# EAGLE design SPSU (EAGLE 9.6.2)
PCB_VERSION: V3.0; SCHEMATIC_VERSION: V3.0

## Sheet 1 of 6: IO-Extender
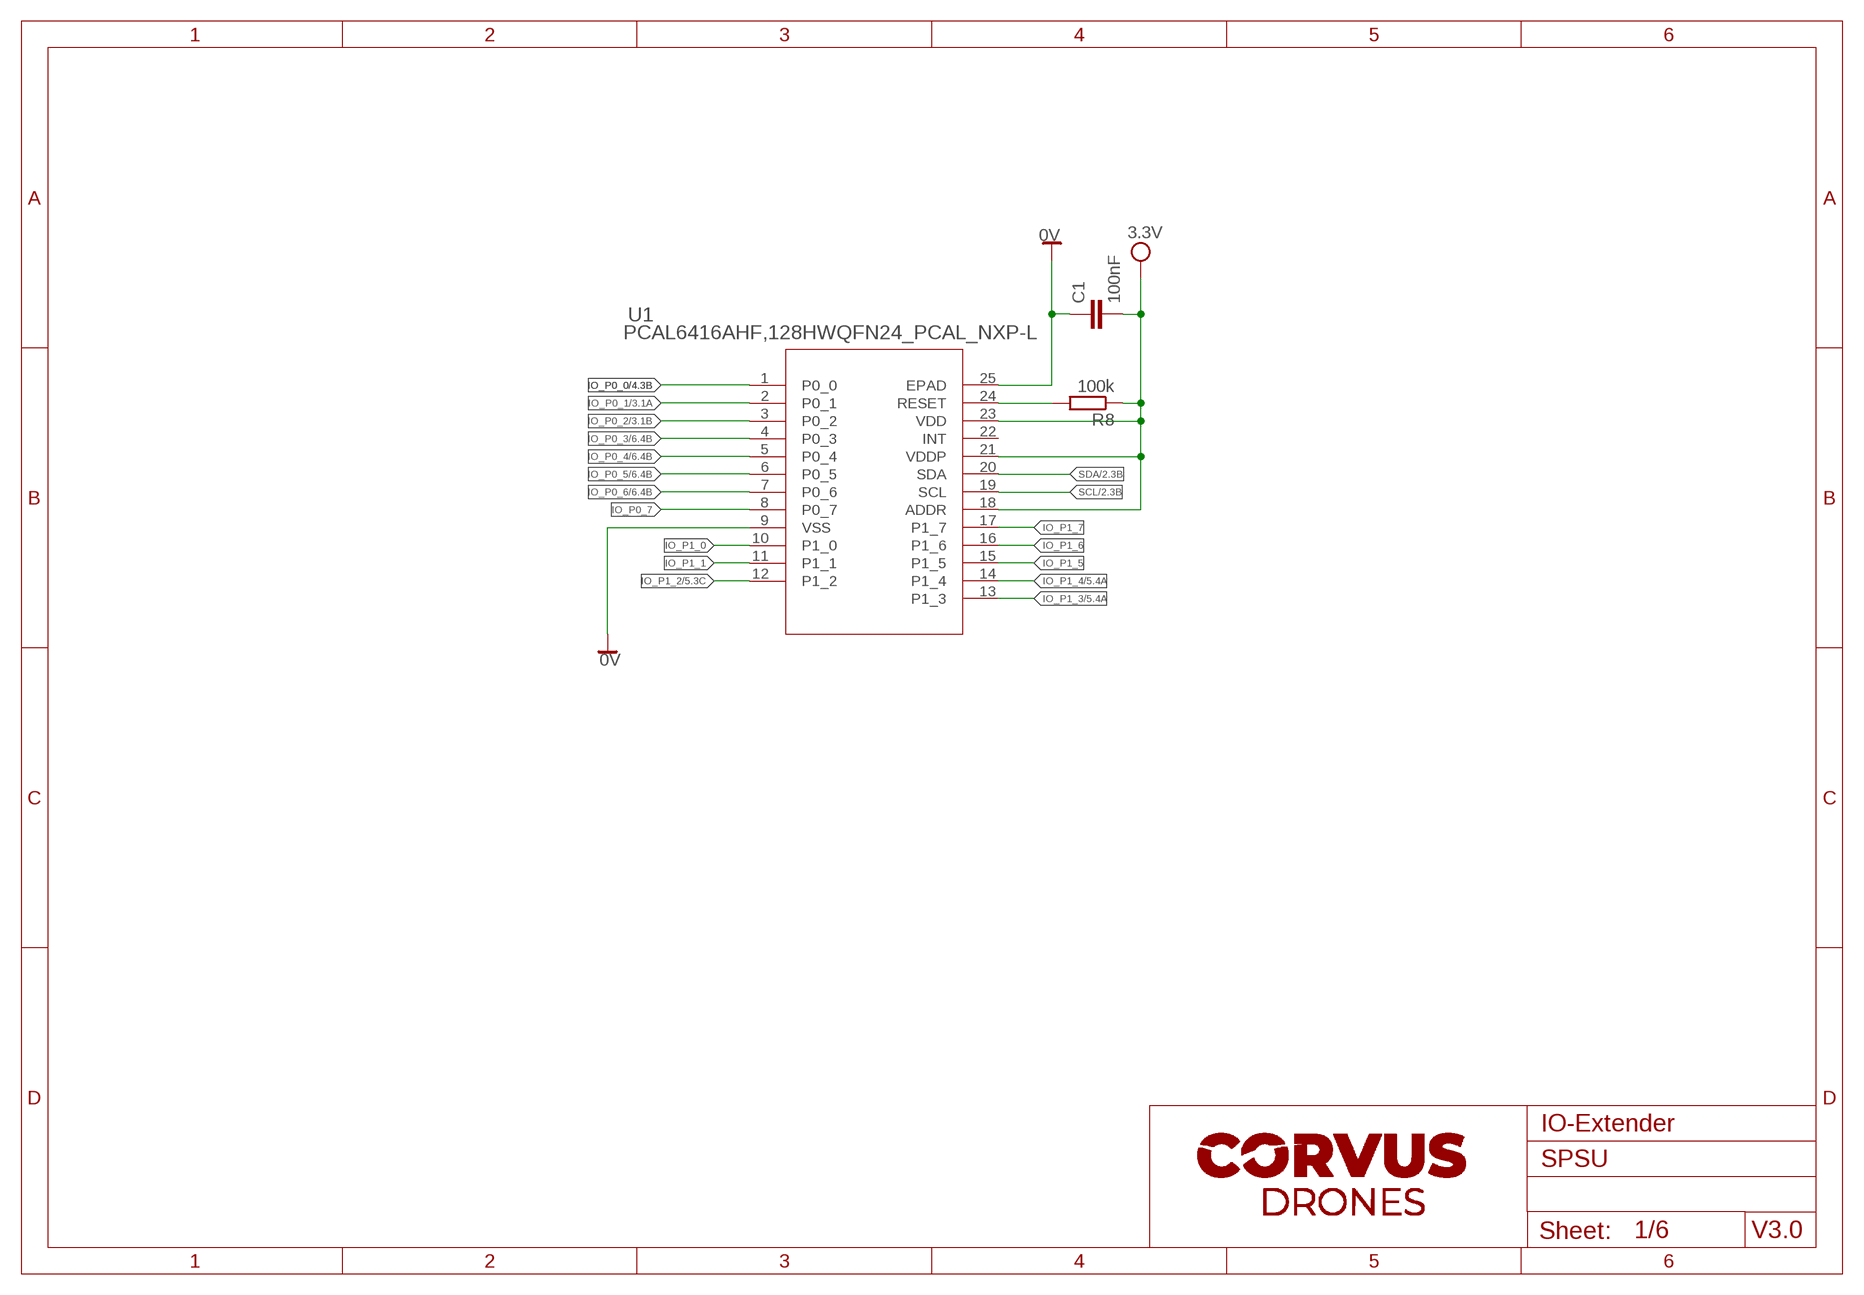
[diagram p0: schematic, sheet 1]

### Parts
C1  100nF  C_0603_100N  [C0603]
R8  100k  R_0603_100K  [R0603]
U1  PCAL6416AHF,128HWQFN24_PCAL_NXP-L  [HWQFN24_PCAL_NXP-L]

### Nets
0V: C1.1 U1.9(VSS) U1.25(EPAD) ; also sheet 2,3,4,5,6
IO_P0_0: U1.1(P0_0) ; also sheet 4
IO_P0_1: U1.2(P0_1) ; also sheet 3
IO_P0_2: U1.3(P0_2) ; also sheet 3
IO_P0_3: U1.4(P0_3) ; also sheet 6
IO_P0_4: U1.5(P0_4) ; also sheet 6
IO_P0_5: U1.6(P0_5) ; also sheet 6
IO_P0_6: U1.7(P0_6) ; also sheet 6
IO_P0_7: U1.8(P0_7)
IO_P1_0: U1.10(P1_0)
IO_P1_1: U1.11(P1_1)
IO_P1_2: U1.12(P1_2) ; also sheet 5
IO_P1_3: U1.13(P1_3) ; also sheet 5
IO_P1_4: U1.14(P1_4) ; also sheet 5
IO_P1_5: U1.15(P1_5)
IO_P1_6: U1.16(P1_6)
IO_P1_7: U1.17(P1_7)
N$7: R8.2 U1.24(RESET)
SCL: U1.19(SCL) ; also sheet 2,4
SDA: U1.20(SDA) ; also sheet 2,4
VDD: C1.2 R8.1 U1.18(ADDR) U1.21(VDDP) U1.23(VDD) ; supply symbol labelled 3.3V ; also sheet 2
Unconnected: U1.22(INT)

## Sheet 2 of 6: Connection Powermodule
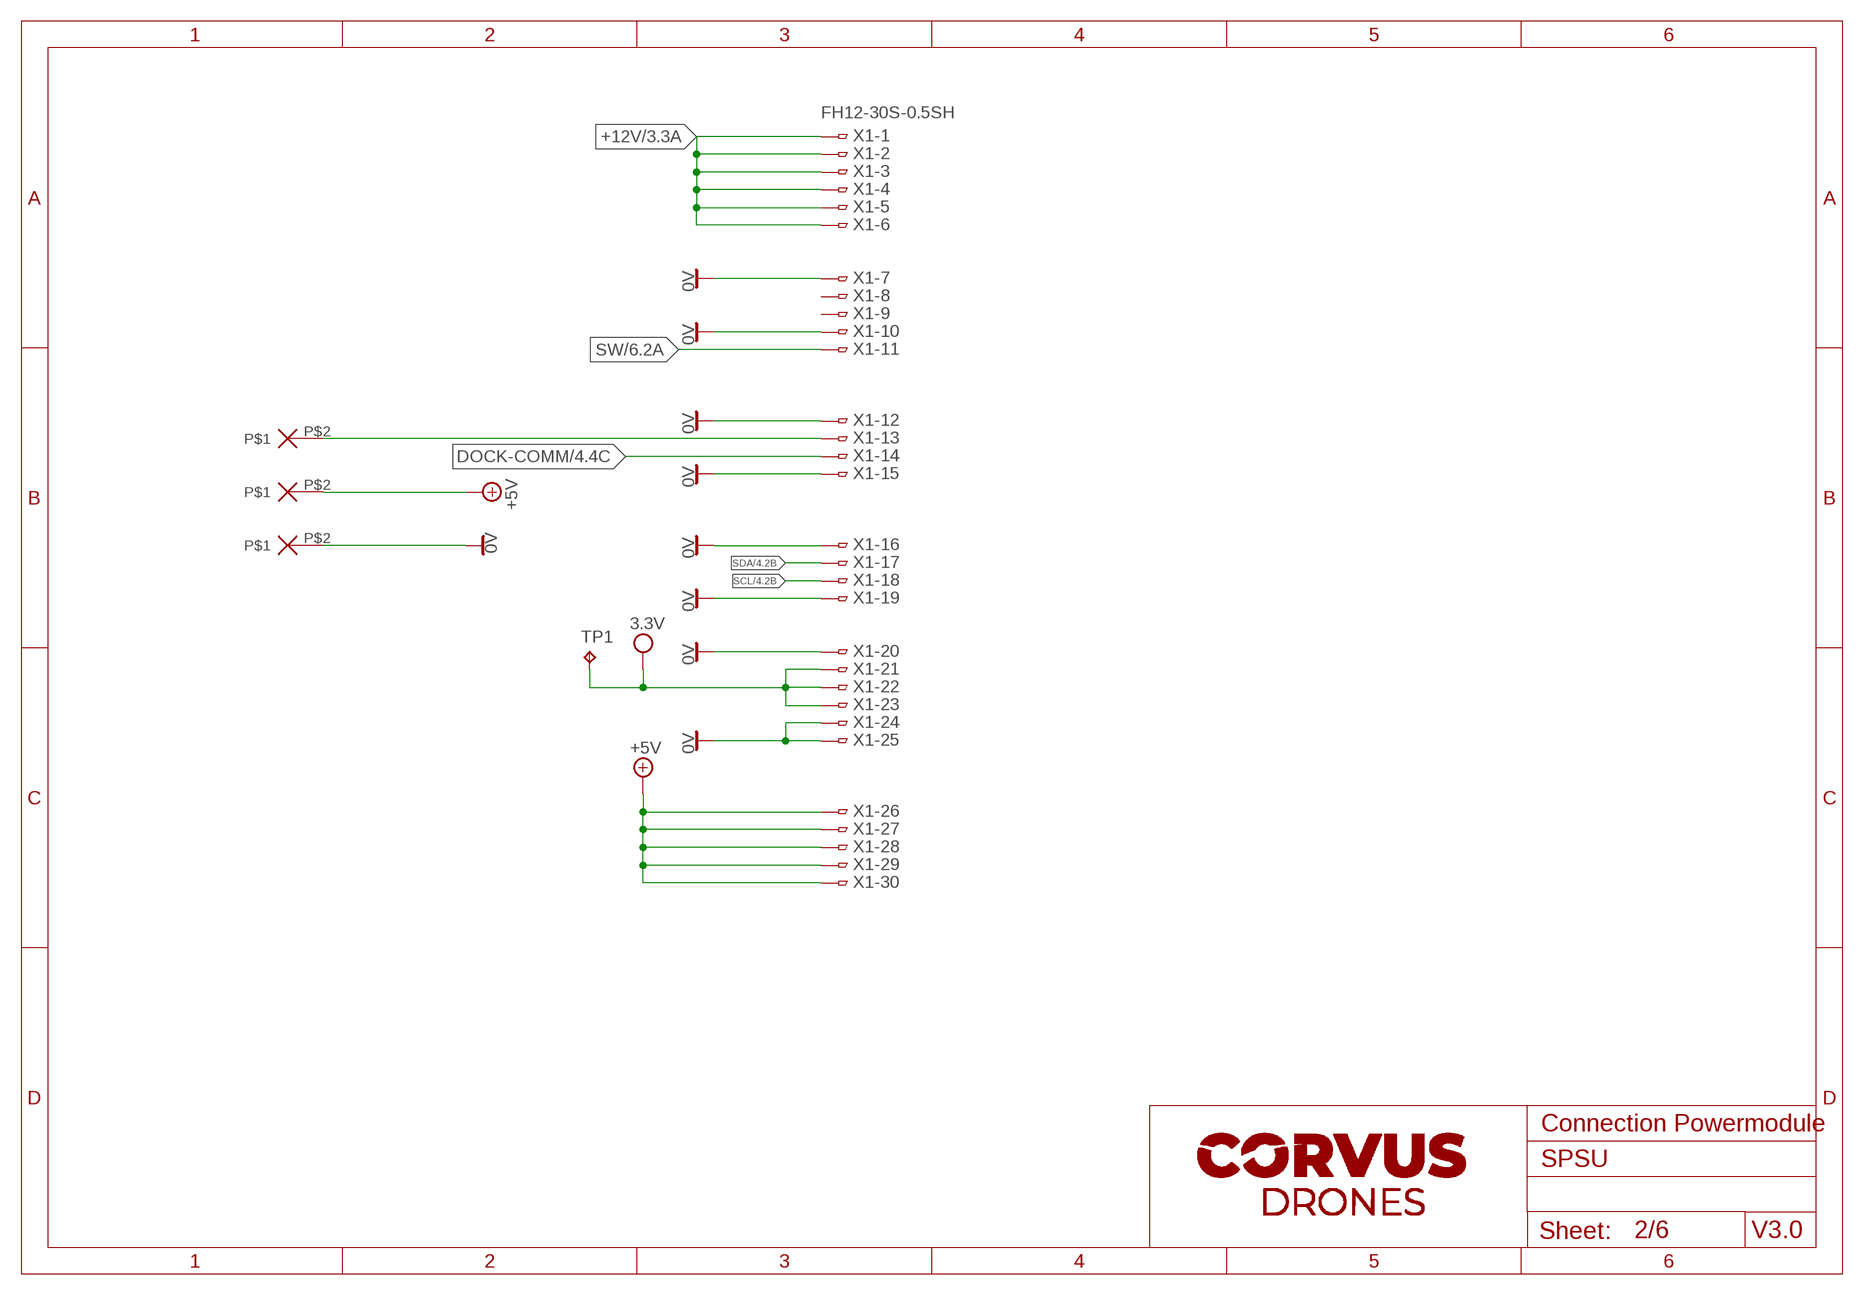
[diagram p1: schematic, sheet 2]

### Parts
+  TH-0.75/0.6  [TH-0.75/0.6]
-  TH-0.75/0.6  [TH-0.75/0.6]
D  TH-0.75/0.6  [TH-0.75/0.6]
TP1  TPTP11R  [TP11R]
X1  FH12-30S-0.5SH  [FH12-30S-0.5SH]

### Nets
0V: -.P$2 X1.7 X1.10 X1.12 X1.15 X1.16 X1.19 X1.20 X1.24 X1.25 ; also sheet 1,3,4,5,6
+5V: +.P$2 X1.26 X1.27 X1.28 X1.29 X1.30 ; also sheet 3,5
+12V: X1.1 X1.2 X1.3 X1.4 X1.5 X1.6 ; also sheet 3,4
DOCK-COMM: X1.14 ; also sheet 4
N$13: D.P$2 X1.13
SCL: X1.18 ; also sheet 1,4
SDA: X1.17 ; also sheet 1,4
SW: X1.11 ; also sheet 6
VDD: TP1.TP X1.21 X1.22 X1.23 ; supply symbol labelled 3.3V ; also sheet 1
Unconnected: X1.8 X1.9

## Sheet 3 of 6: Mosfet driving
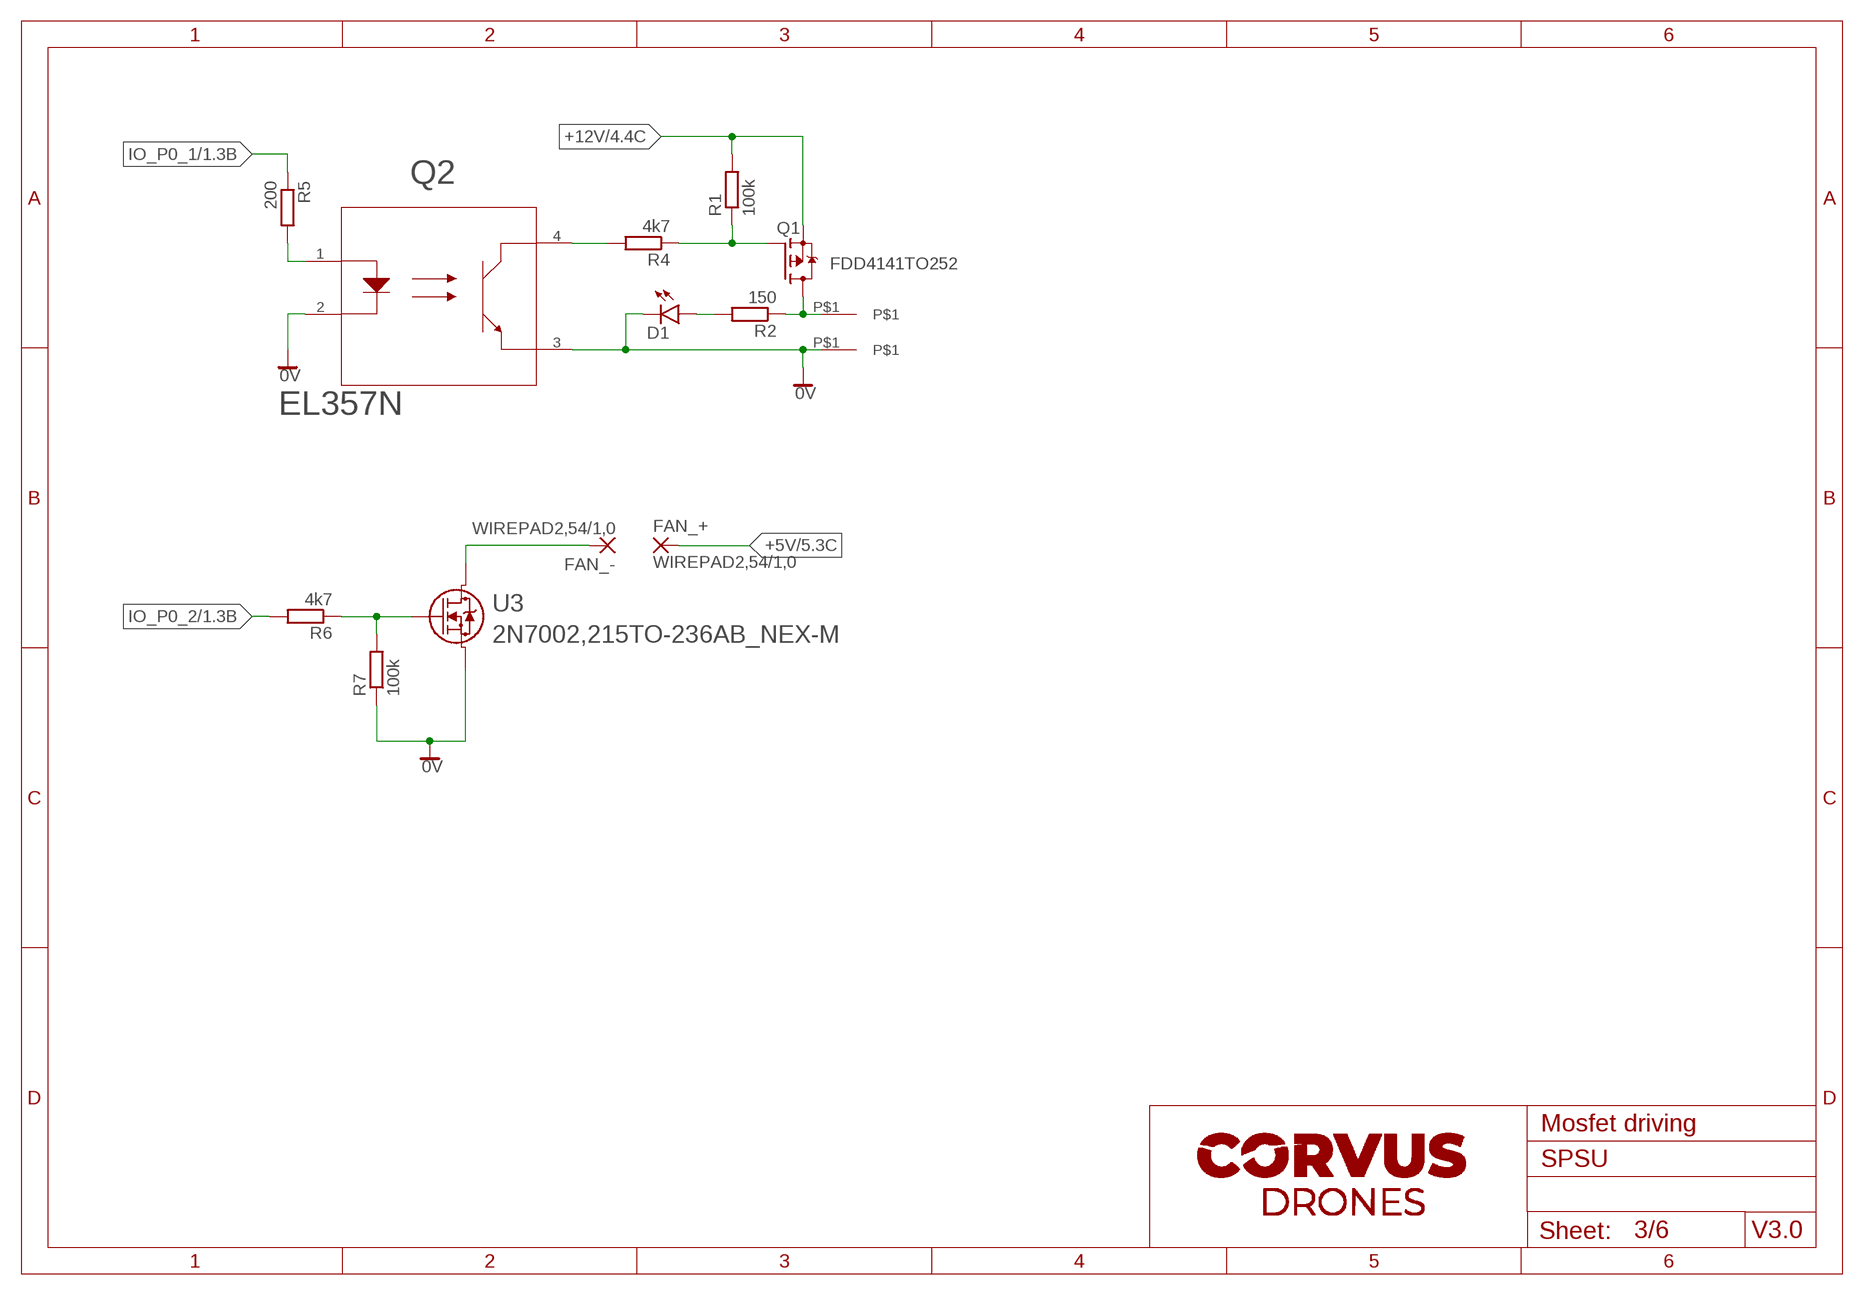
[diagram p2: schematic, sheet 3]

### Parts
D1  LEDCHIPLED_0805  [CHIPLED_0805]
ESC+  ESC  [ESC]
ESC-  ESC  [ESC]
FAN_+  WIREPAD2,54/1,0  [2,54/1,0]
FAN_-  WIREPAD2,54/1,0  [2,54/1,0]
Q1  FDD4141TO252  [TO252]
Q2  EL357N  EL357N(C)(TA)-VGEL357N(C)(TA)-VG_EVE-L  [EL357N(C)(TA)-VG_EVE-L]
R1  100k  R_0603_100K  [R0603]
R2  150  R-EU_R0603  [R0603]
R4  4k7  R_0603_4K7  [R0603]
R5  200  R-EU_R0603  [R0603]
R6  4k7  R_0603_4K7  [R0603]
R7  100k  R_0603_100K  [R0603]
U3  2N7002,215TO-236AB_NEX-M  [TO-236AB_NEX-M]

### Nets
0V: D1.C ESC-.P$1 Q2.2 Q2.3 R7.1 U3.2 ; also sheet 1,2,4,5,6
+5V: FAN_+.1(P) ; also sheet 2,5
+12V: Q1.2(S) R1.2 ; also sheet 2,4
ESC_+: ESC+.P$1 Q1.3(D) R2.1
IO_P0_1: R5.1 ; also sheet 1
IO_P0_2: R6.2 ; also sheet 1
N$1: Q1.1(G) R1.1 R4.1
N$2: D1.A R2.2
N$3: Q2.4 R4.2
N$4: Q2.1 R5.2
N$5: R6.1 R7.2 U3.1
N$6: FAN_-.1(P) U3.3

## Sheet 4 of 6: Pad connections
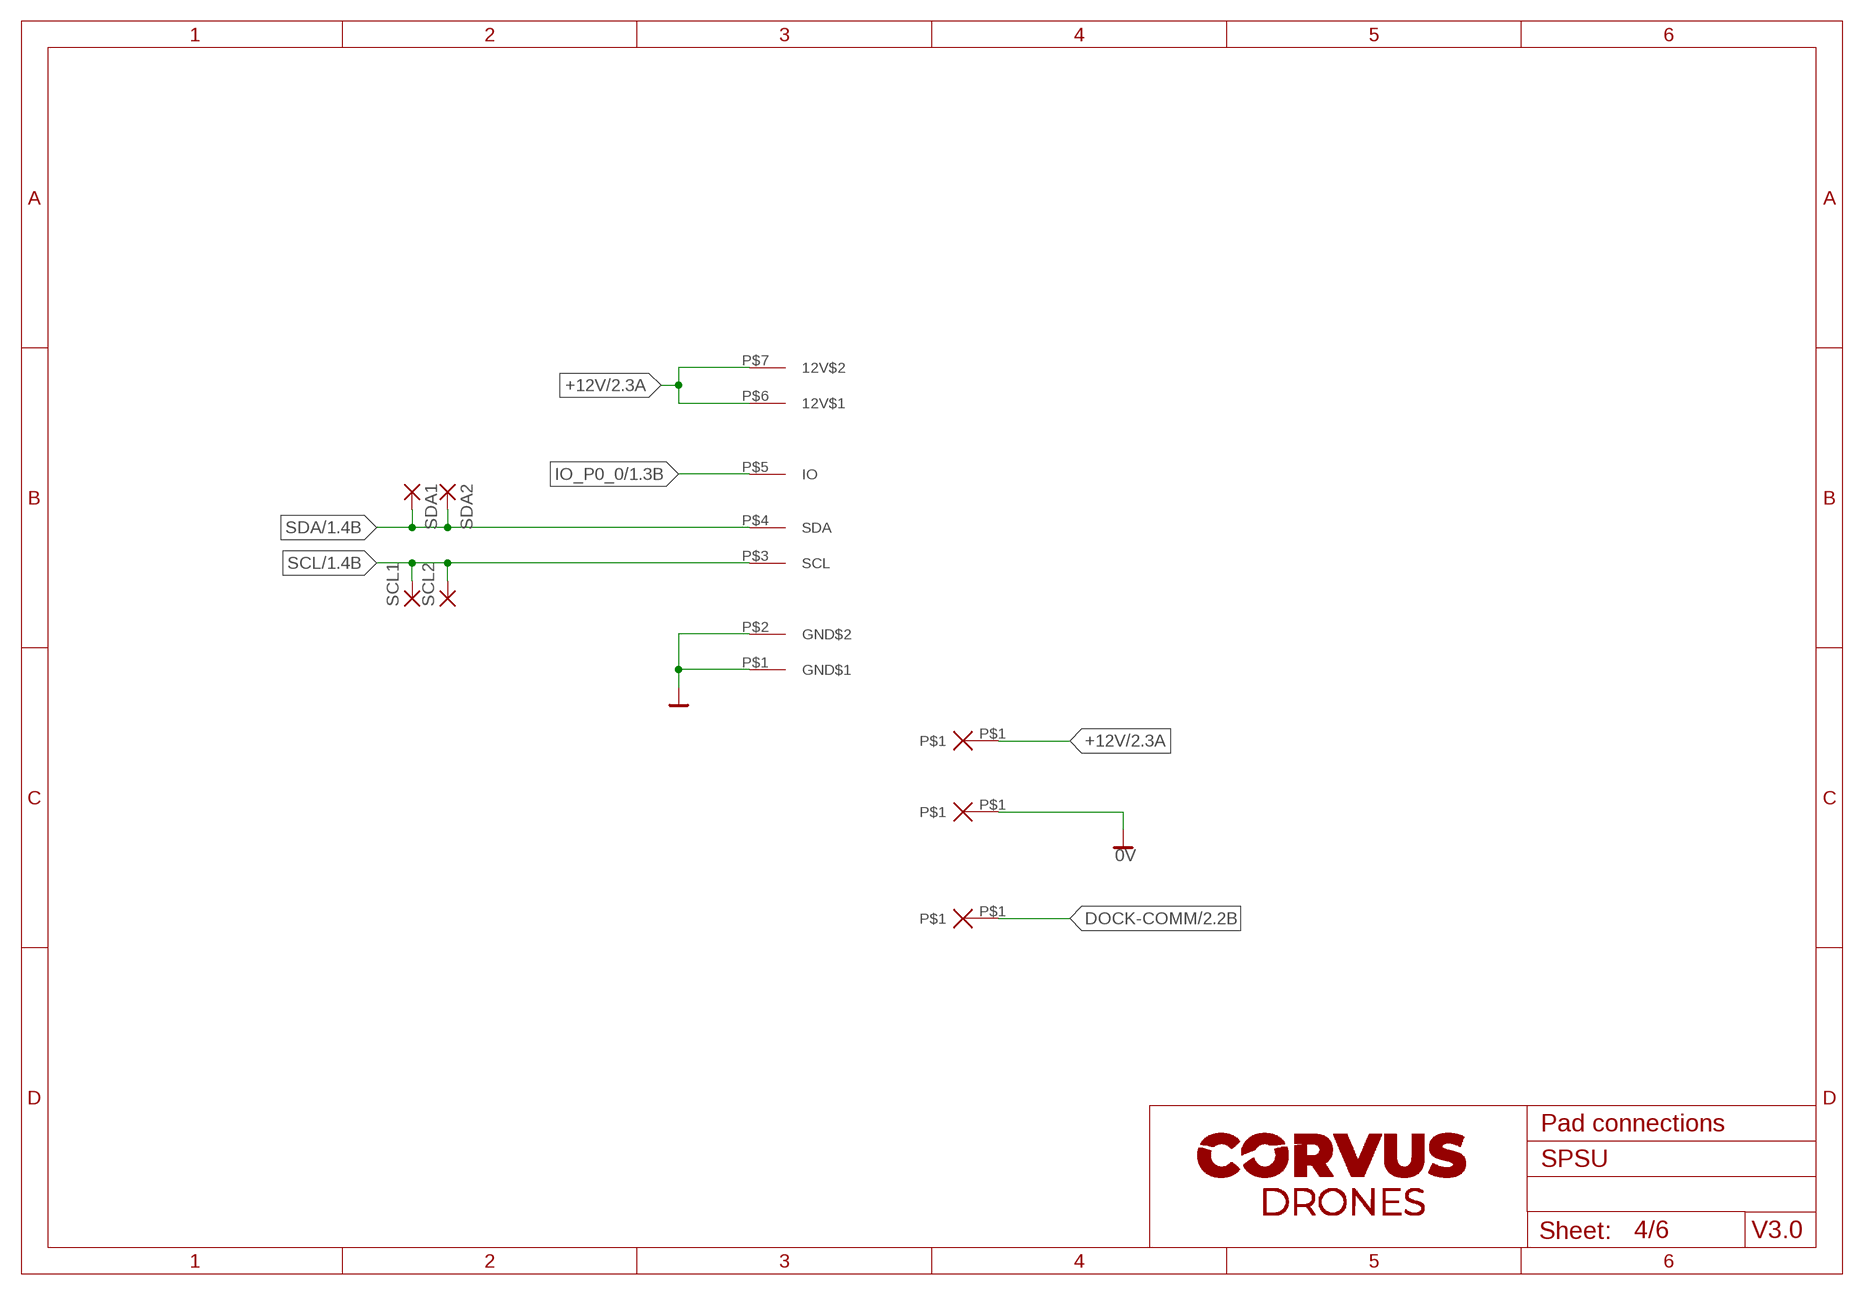
[diagram p3: schematic, sheet 4]

### Parts
CHG+  SMT-PAD_SQ6MM  [SMT-PAD_SQ6MM]
CHG-  SMT-PAD_SQ6MM  [SMT-PAD_SQ6MM]
SCL1  1,6/0,8  [1,6/0,8]
SCL2  1,6/0,8  [1,6/0,8]
SDA1  1,6/0,8  [1,6/0,8]
SDA2  1,6/0,8  [1,6/0,8]
U$1  BATT_CON_THT  [BATT_CON_THT]
U$2  SMT-PAD_R3MM  [SMT-PAD_R3MM]

### Nets
0V: CHG-.P$1 U$1.P$1(GND$1) U$1.P$2(GND$2) ; also sheet 1,2,3,5,6
+12V: CHG+.P$1 U$1.P$6(12V$1) U$1.P$7(12V$2) ; also sheet 2,3
DOCK-COMM: U$2.P$1 ; also sheet 2
IO_P0_0: U$1.P$5(IO) ; also sheet 1
SCL: SCL1.1(P) SCL2.1(P) U$1.P$3(SCL) ; also sheet 1,2
SDA: SDA1.1(P) SDA2.1(P) U$1.P$4(SDA) ; also sheet 1,2

## Sheet 5 of 6: ADB detection
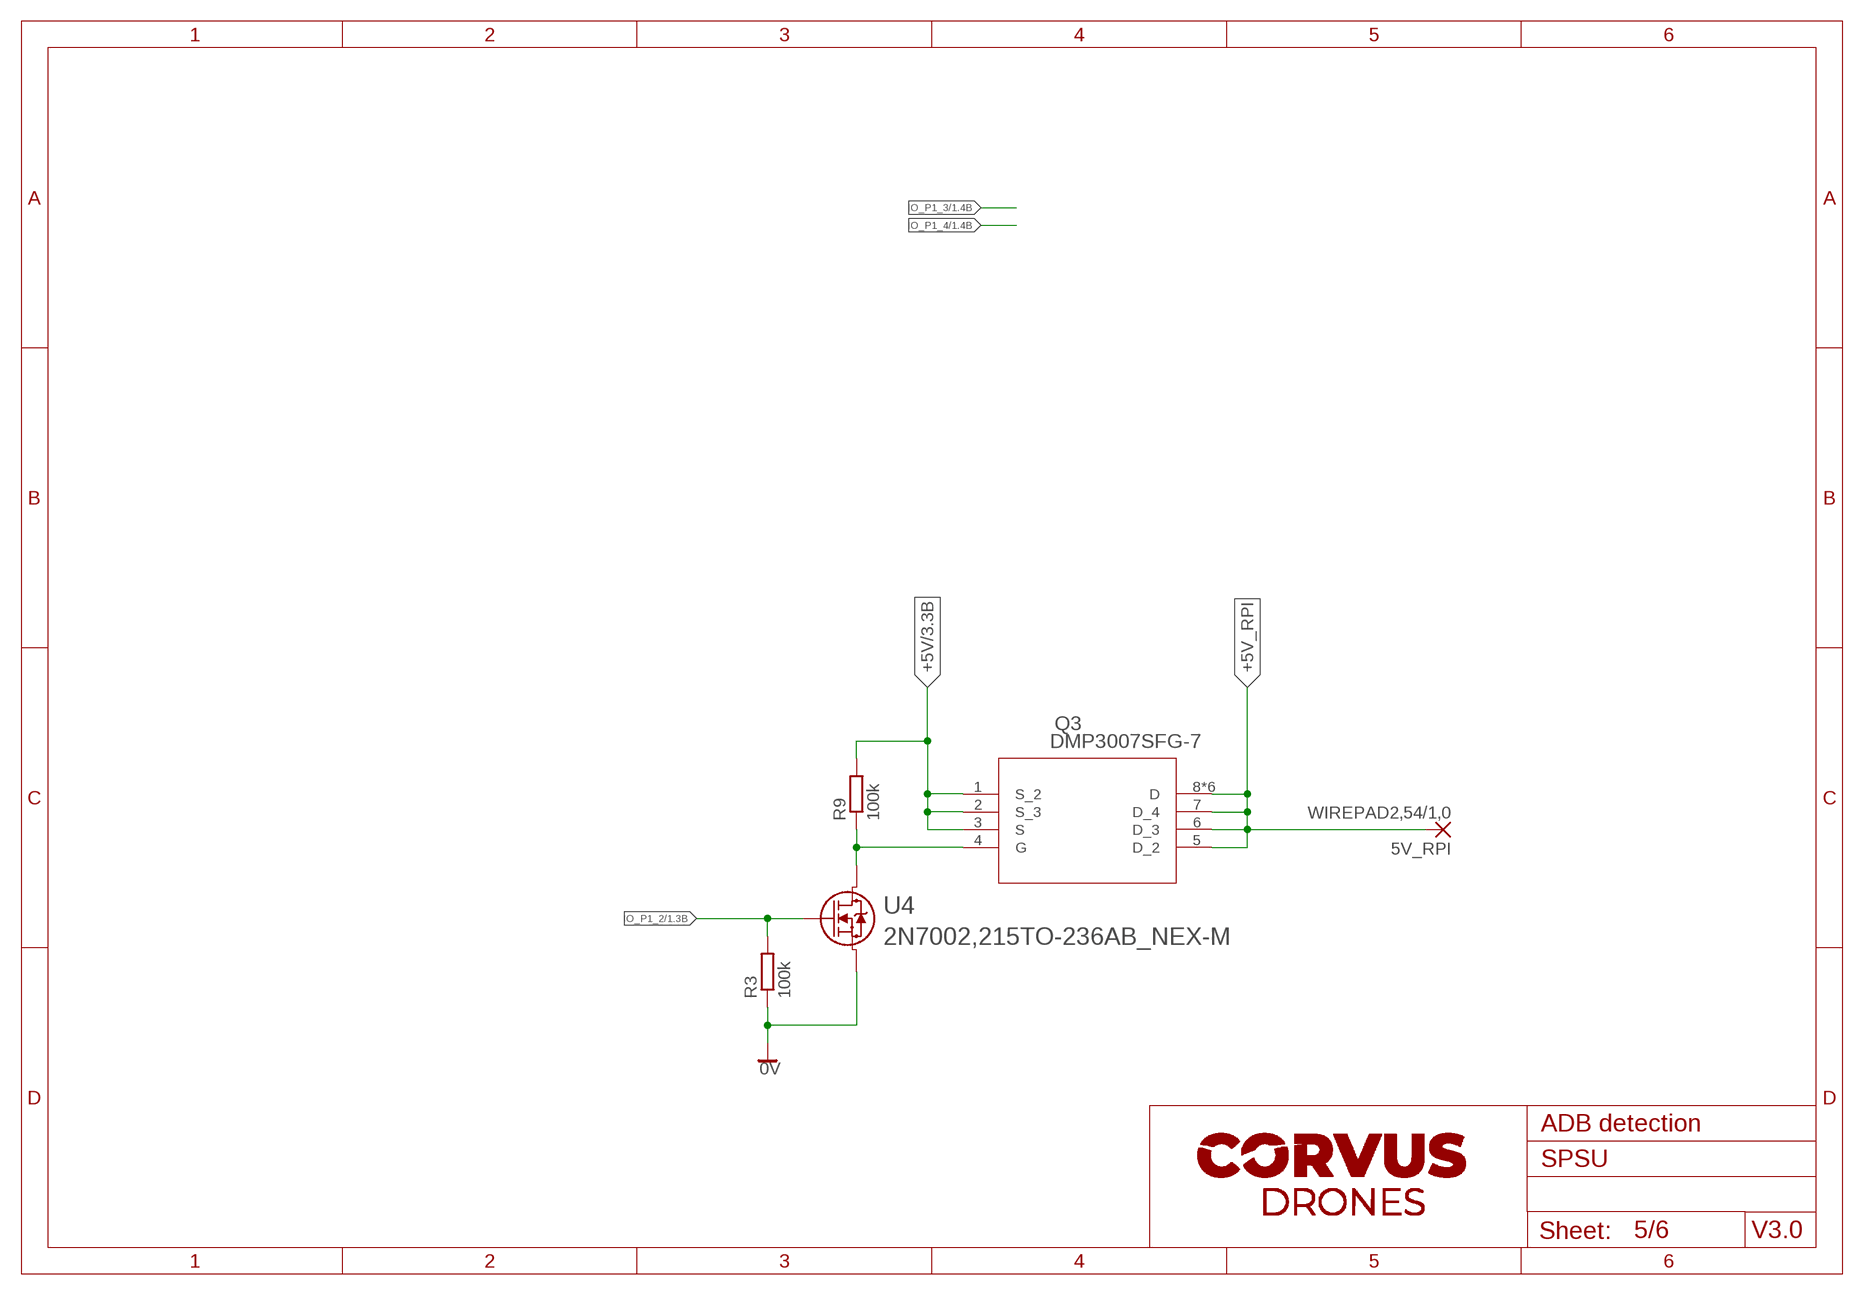
[diagram p4: schematic, sheet 5]

### Parts
5V_RPI  WIREPAD2,54/1,0  [2,54/1,0]
Q3  DMP3007SFG-7  [POWERDI3333-8_3P3X3P3_DIO]
R3  100k  R_0603_100K  [R0603]
R9  100k  R_0603_100K  [R0603]
U4  2N7002,215TO-236AB_NEX-M  [TO-236AB_NEX-M]

### Nets
0V: R3.1 U4.2 ; also sheet 1,2,3,4,6
+5V: Q3.1(S_2) Q3.2(S_3) Q3.3(S) R9.2 ; also sheet 2,3
+5V_RPI: 5V_RPI.1(P) Q3.5(D_2) Q3.6(D_3) Q3.7(D_4) Q3.8(D) Q3.9(D) Q3.10(D) Q3.11(D) Q3.12(D) Q3.13(D)
IO_P1_2: R3.2 U4.1 ; also sheet 1
N$8: Q3.4(G) R9.1 U4.3

## Sheet 6 of 6: HMI Part
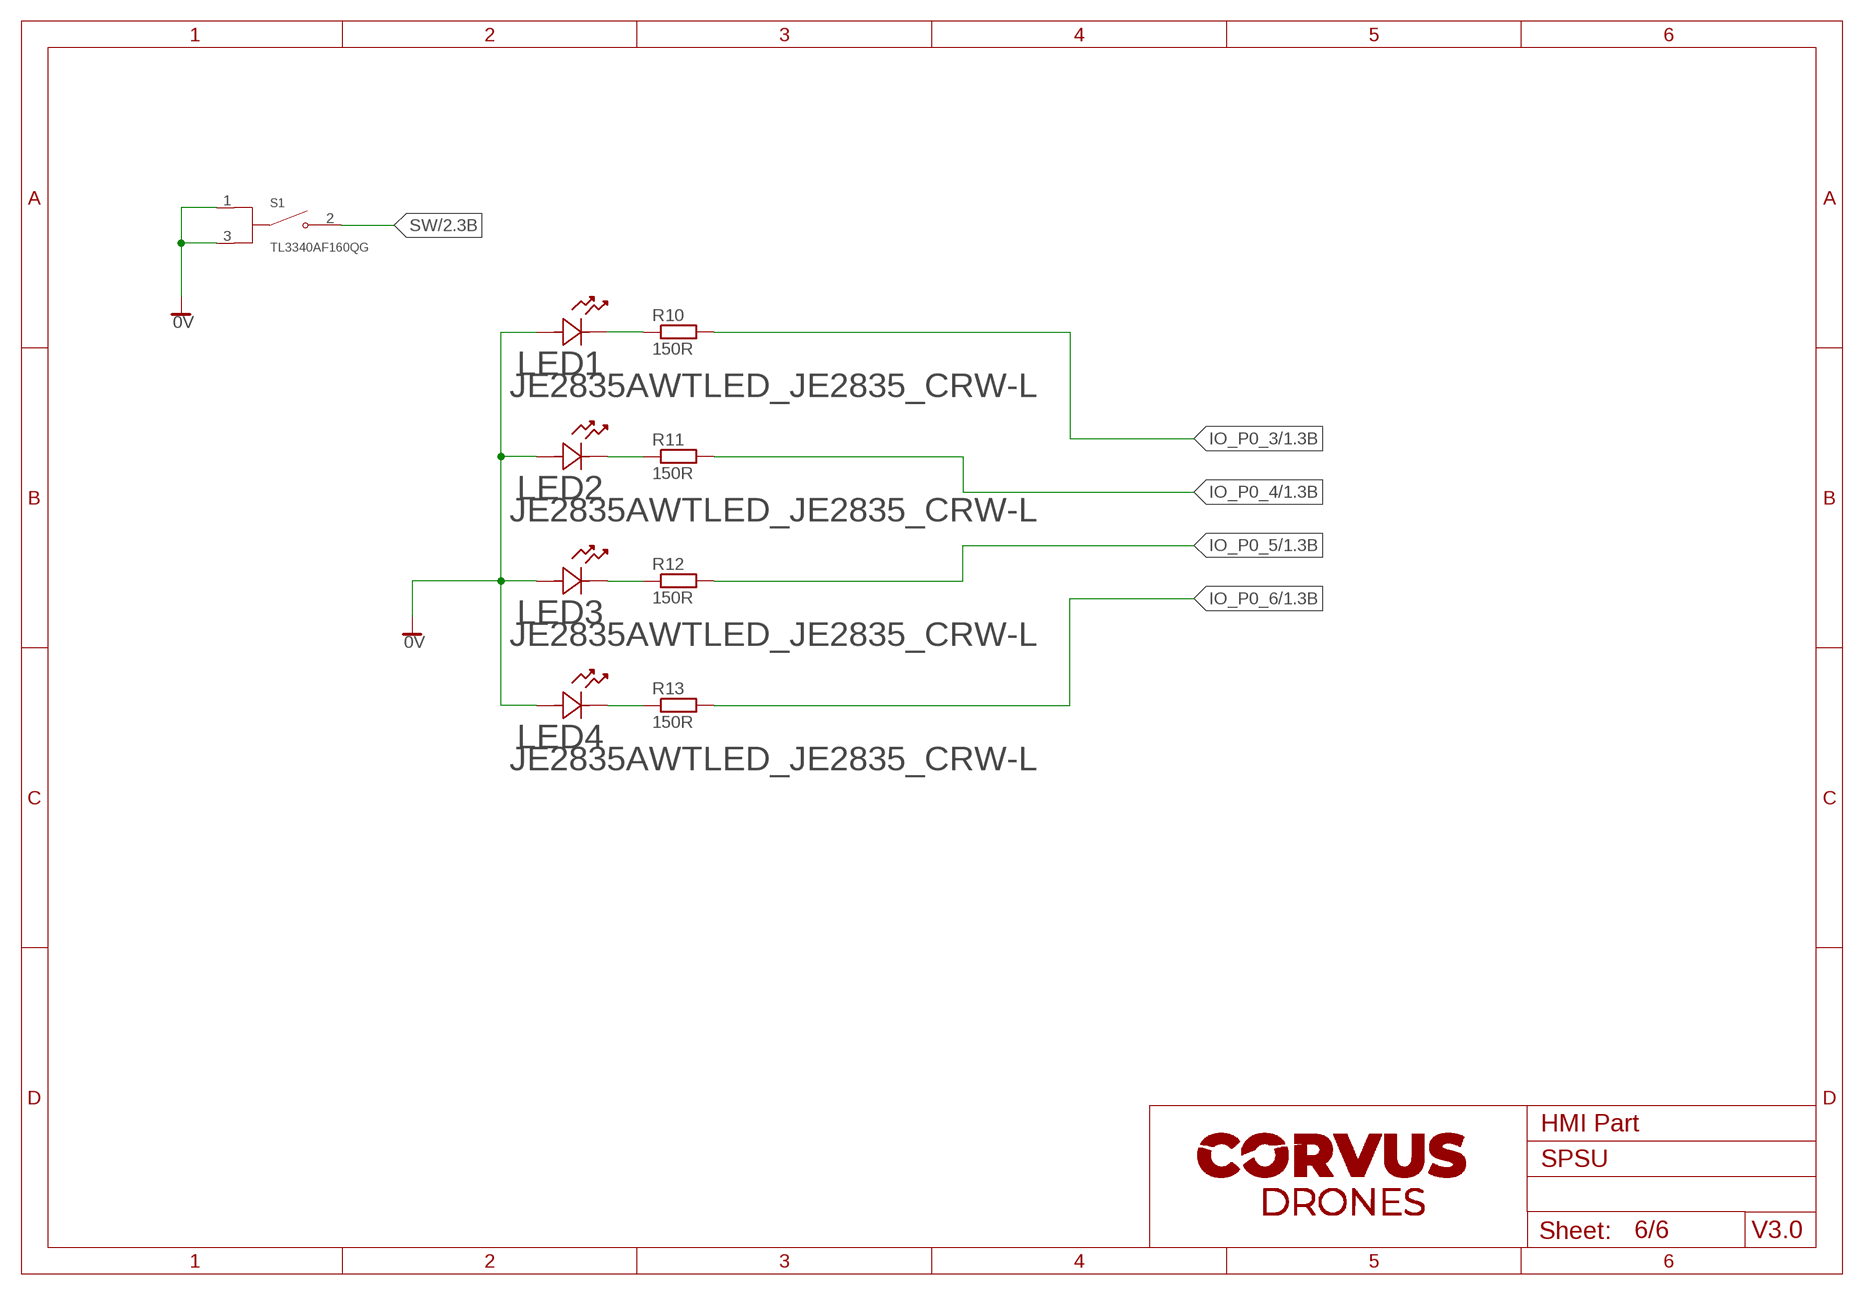
[diagram p5: schematic, sheet 6]

### Parts
LED1  JE2835AWTLED_JE2835_CRW-L  [LED_JE2835_CRW-L]
LED2  JE2835AWTLED_JE2835_CRW-L  [LED_JE2835_CRW-L]
LED3  JE2835AWTLED_JE2835_CRW-L  [LED_JE2835_CRW-L]
LED4  JE2835AWTLED_JE2835_CRW-L  [LED_JE2835_CRW-L]
R10  150R  R_0603_150R  [R0603]
R11  150R  R_0603_150R  [R0603]
R12  150R  R_0603_150R  [R0603]
R13  150R  R_0603_150R  [R0603]
S1  TL3340AF160QG  [SW_TL3340AF160QG]

### Nets
0V: LED1.1 LED2.1 LED3.1 LED4.1 S1.1(COM_1) S1.3(COM_2) ; also sheet 1,2,3,4,5
IO_P0_3: R10.2 ; also sheet 1
IO_P0_4: R11.2 ; also sheet 1
IO_P0_5: R12.2 ; also sheet 1
IO_P0_6: R13.2 ; also sheet 1
N$9: LED1.2 R10.1
N$10: LED2.2 R11.1
N$11: LED3.2 R12.1
N$12: LED4.2 R13.1
SW: S1.2(NO) ; also sheet 2

## Library data of the parts
5V_RPI FAN_+ FAN_- = wirepad:WIREPAD: Wire PAD connect wire on PCB
+ - D = corvus_holes:TH-0.75/0.6
C1 = corvus_RC:C_0603; FARNELL: 2320813
CHG+ CHG- = corvus_holes:SMT-PAD_SQ6MM
D1 = led_CUSTOM:LED: LED OSRAM: - CHIPLED LG R971, LG N971, LY N971, LG Q971, LY Q971, LO R971, LY R971 LH N974, LH R974 LS Q976, LO Q976, LY Q976 LO Q996 - Hyper CHIPLED LW Q18S LB Q993, LB Q99A, LB R99A - SideLED LS A670, LO A670, LY A670, LG A670, LP A670 LB A673, LV A673, LT A673, LW A673 LH A674 LY A675 LS A676, LA A676, LO A676, LY A676, LW A676 LS A679, LY A679, LG A679 - Hyper Micro SIDELED® LS Y876, LA Y876, LO Y876, LY Y876 LT Y87S - SmartLED LW L88C, LW L88S LB L89C, LB L89S, LG L890 LS L89K, LO L89K, LY L89K LS L896, LA L896, LO L896, LY L896 - TOPLED LS T670, LO T670, LY T670, LG T670, LP T670 LSG T670, LSP T670, LSY T670, LOP T670, LYG T670 LG T671, LOG T671, LSG T671 LB T673, LV T673, LT T673, LW T673 LH T674 LS T676, LA T676, LO T676, LY T676, LB T676, LH T676, LSB T676, LW T676 LB T67C, LV T67C, LT T67C, LS T67K, LO T67K, LY T67K, LW E67C LS E67B, LA E67B, LO E67B, LY E67B, LB E67C, LV E67C, LT E67C LW T67C LS T679, LY T679, LG T679 LS T770, LO T770, LY T770, LG T770, LP T770 LB T773, LV T773, LT T773, LW T773 LH T774 LS E675, LA E675, LY E675, LS T675 LS T776, LA T776, LO T776, LY T776, LB T776 LHGB T686 LT T68C, LB T68C - Hyper Mini TOPLED® LB M676 - Mini TOPLED Santana® LG M470 LS M47K, LO M47K, LY M47K Source: http://www.osram.convergy.de LUXEON: - LUMILED® LXK2-PW12-R00, LXK2-PW12-S00, LXK2-PW14-U00, LXK2-PW14-V00 LXK2-PM12-R00, LXK2-PM12-S00, LXK2-PM14-U00 LXK2-PE12-Q00, LXK2-PE12-R00, LXK2-PE12-S00, LXK2-PE14-T00, LXK2-PE14-U00 LXK2-PB12-K00, LXK2-PB12-L00, LXK2-PB12-M00, LXK2-PB14-N00, LXK2-PB14-P00, LXK2-PB14-Q00 LXK2-PR12-L00, LXK2-PR12-M00, LXK2-PR14-Q00, LXK2-PR14-R00 LXK2-PD12-Q00, LXK2-PD12-R00, LXK2-PD12-S00 LXK2-PH12-R00, LXK2-PH12-S00 LXK2-PL12-P00, LXK2-PL12-Q00, LXK2-PL12-R00 Source: www.luxeon.com KINGBRIGHT: KA-3528ASYC Source: www.kingbright.com
ESC+ ESC- = corvus:ESC
LED1-LED4 = HBLED:JE2835AWT; COPYRIGHT: Copyright (C) 2022 Ultra Librarian. All rights reserved.; MANUFACTURER_PART_NUMBER: JE2835AWT-00-0000-000A0UF830E; MFR_NAME: Wolfspeed
Q1 = transistor-fet:FDD4141: P-Channel PowerTrench® MOSFET Source: FDD4141.pdf
Q2 = EL357N:EL357N(C)(TA)-VG; COPYRIGHT: Copyright (C) 2022 Ultra Librarian. All rights reserved.; DIGI-KEY_PART_NUMBER_1: 1080-1601-2-ND; DIGI-KEY_PART_NUMBER_2: 1080-1601-1-ND; DIGI-KEY_PART_NUMBER_3: 1080-1601-6-ND; MANUFACTURER_PART_NUMBER: EL357N(C)(TA)-VG; MFR_NAME: Everlight
Q3 = Mosfets:DMP3007SFG-7; COPYRIGHT: Copyright (C) 2022 Ultra Librarian. All rights reserved.; MANUFACTURER_PART_NUMBER: DMP3007SFG-7; MFR_NAME: Diodes Inc
R1 R3 R7-R9 = corvus_RC:R_0603; FARNELL: 2447226
R2 R5 = rcl_CUSTOM:R-EU_: RESISTOR, European symbol; SPICEPREFIX: R
R4 R6 = corvus_RC:R_0603; FARNELL: 2447385
R10-R13 = corvus_RC:R_0603
S1 = corvus_parts:TL3340AF160QG: Check availability <https://pricing.snapeda.com/parts/TL3340AF160QG/E-Switch/view-part?ref=eda>; DIGIKEY: EG4627TR-ND; FARNELL: 2787247; MOUSSER: 612-TL3340AF160QG
SCL1 SCL2 SDA1 SDA2 = wirepad:1,6/0,8: THROUGH-HOLE PAD
TP1 = corvus_holes:TP
U1 = PCAL6416AHF:PCAL6416AHF,128; COPYRIGHT: Copyright (C) 2022 Ultra Librarian. All rights reserved.; MANUFACTURER_PART_NUMBER: PCAL6416AHF,128; MFR_NAME: NXP
U3 U4 = 2n7002:2N7002,215; COPYRIGHT: Copyright (C) 2022 Ultra Librarian. All rights reserved.; MANUFACTURER_PART_NUMBER: 2N7002,215; MFR_NAME: Nexperia
U$1 = corvus_parts:BATT_CON_THT
U$2 = corvus_holes:SMT-PAD_R3MM
X1 = corvus_parts:FH12-30S-0.5S; FARNELL: 1324555

## Net classes
0 default: width 0.127 mm, drill 0.2 mm

## Board
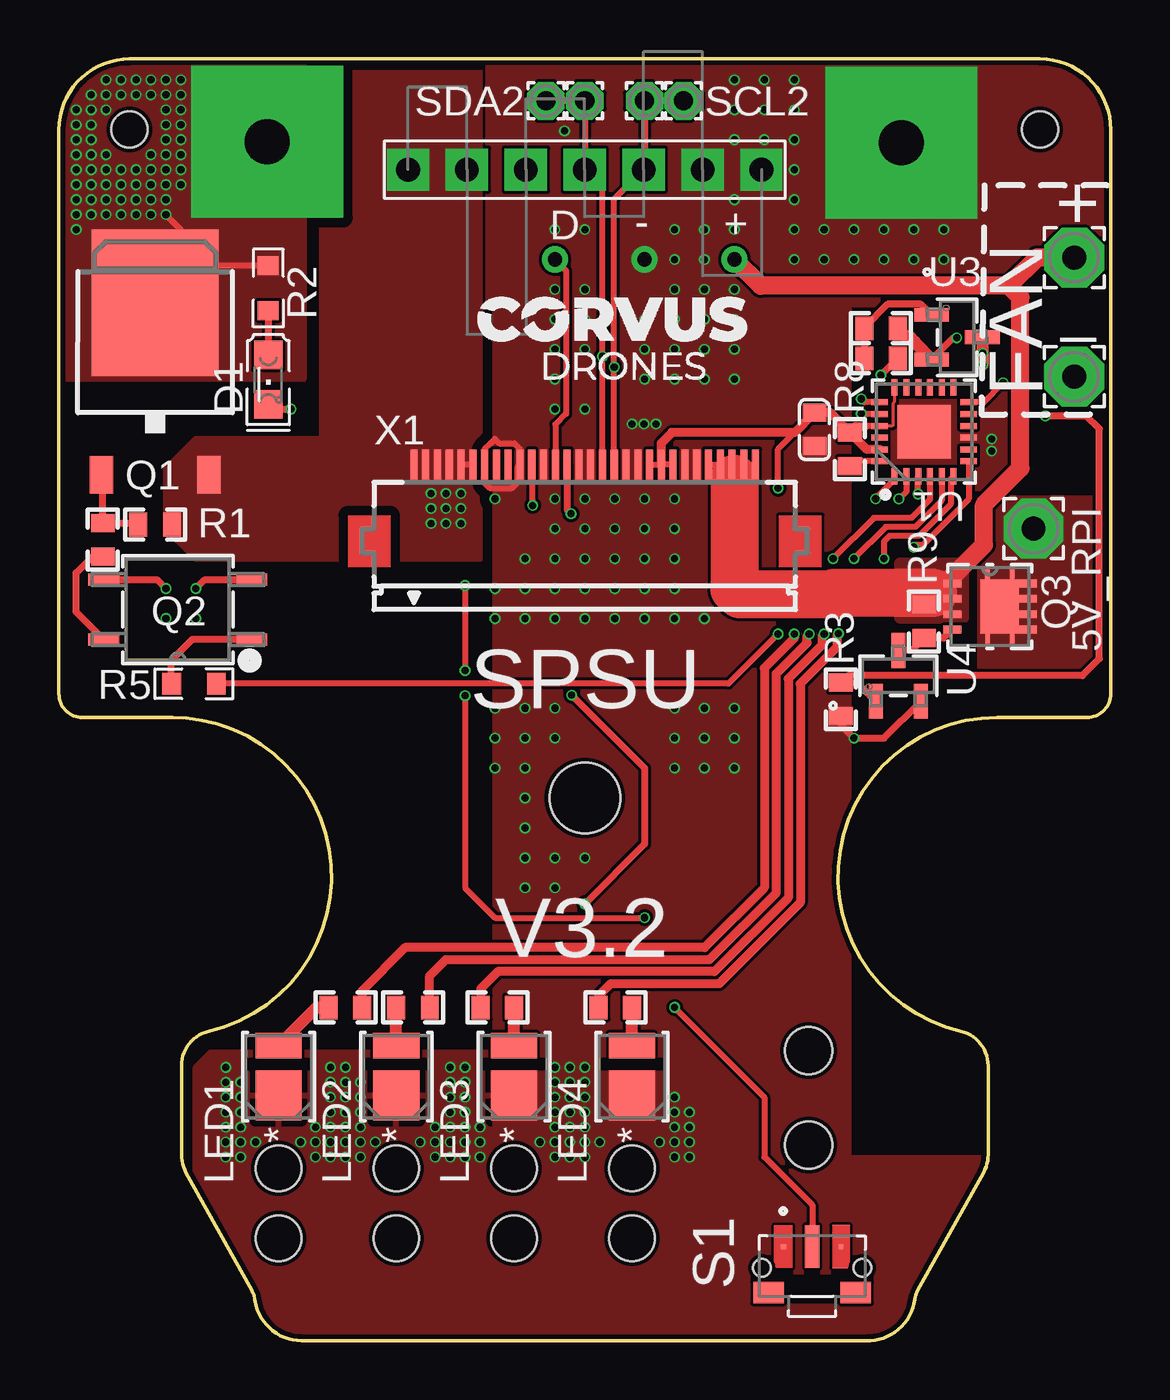
[diagram p6: board, top side]
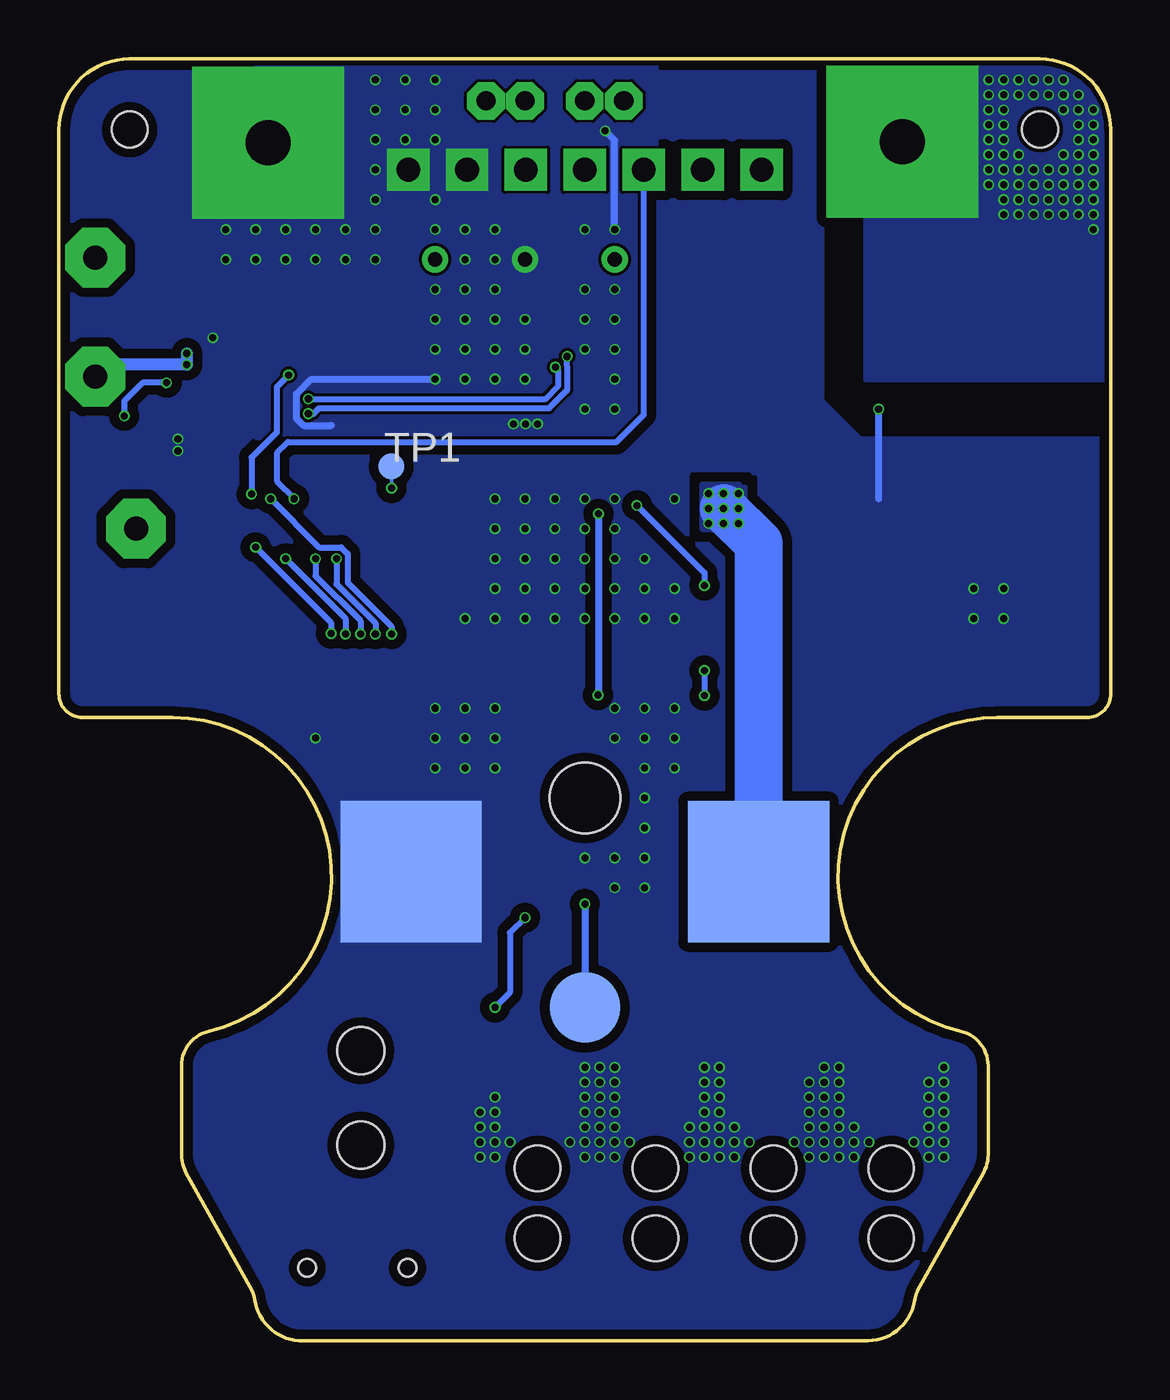
[diagram p7: board, bottom side, seen from below]

Size 44.65 x 54.4 mm. Coordinates in mm from the lower left corner, seen from the top.
Outline: 36.45,2.11 39.25,7.15 arc29 39.44,7.88 39.44,11.67 arc77 38.29,13.13 arc-167 39.82,26.45 43.65,26.45 43.73,26.45 arc85 44.65,27.45 44.65,51.4 44.64,51.66 arc85 41.65,54.4 3,54.4 2.74,54.39 arc85 0,51.4 0,27.45 arc90 1,26.45 4.82,26.45 5.41,26.42 arc-162 6.36,13.13 arc77 5.2,11.67 5.2,7.88 arc29 5.39,7.15 8.2,2.11 8.21,2.08 8.25,2 8.28,1.92 8.32,1.75 8.33,1.65 8.37,1.48 arc75 10.3,0 34.35,0 34.45,0 arc80 36.33,1.75 36.34,1.79 36.35,1.87 36.38,1.95 arc-10 36.45,2.11
Copper layers (1*16): Top 0.035mm / dielectric 1.6mm / Bottom 0.035mm
Design rules "jlcpcb-2layers_Corvus": minimum track width 5mil, minimum drill 0.3mm, track to track 5mil, track to pad 5mil, pad to pad 5mil, via to via 5mil, smd to smd 5mil, copper to edge 0.2mm, drill to drill 6mil, minimum pad ring 10mil, minimum via ring 3mil, stop-mask expansion 4mil, vias tented up to drill 0.35mm, thermal gap 10mil
Holes 1.93 mm at 24.32,4.34 24.32,7.31 9.32,7.31 9.32,4.34 14.32,7.31 19.32,4.34 19.32,7.31 14.32,4.34
Holes 2 mm at 31.82,12.3 31.82,8.3
Holes 1.52 mm at 2.99,51.41 41.64,51.4
Holes 3 mm at 22.32,23.03

### Footprints (pad centres in the part's own frame; a part is rotated, then mirrored left to right if it is on the bottom)
2,54/1,0 = drill 1.016 pad 2.54 octagon: 1 0,0
TH-0.75/0.6 = drill 0.6 pad 0.75: P$2 0,0
C0603 = smd 0.762 x 1.001: 1 -0.711,0; 2 0.711,0
SMT-PAD_SQ6MM = smd 6 x 6: P$1 0,0
CHIPLED_0805 = smd 1.2 x 1.2: A 0,-1.05; C 0,1.05
ESC = drill 1.905 pad 6.452 square: P$1 0,0
LED_JE2835_CRW-L = smd 2.134 x 1.956: 1 -0.787,0 | smd 1.067 x 1.956: 2 1.321,0
TO252 = smd 1 x 1.6: 1 -2.28,-4.8; 2 2.28,-4.8 | smd 5.4 x 6.2: 3 0,2.5
EL357N(C)(TA)-VG_EVE-L = smd 1.295 x 0.508: 1 -3.15,1.27; 2 -3.15,-1.27; 3 3.15,-1.27; 4 3.15,1.27
POWERDI3333-8_3P3X3P3_DIO = smd 0.762 x 0.33: 1 -1.6,0.975; 2 -1.6,0.325; 3 -1.6,-0.325; 4 -1.6,-0.975; 5 1.6,-0.975; 6 1.6,-0.325; 7 1.6,0.325; 8 1.6,0.975 | smd 1.626 x 2.286: 9 0.415,0 | smd 0.203 x 0.508: 10 -0.104,1.394; 11 0.94,1.394; 12 -0.102,-1.374; 13 0.94,-1.374
R0603 = smd 0.762 x 1.001: 1 -0.711,0; 2 0.711,0
R0603' = smd 0.8 x 0.9: 1 -0.95,0; 2 0.95,0
SW_TL3340AF160QG = smd 0.2 x 0.2: 1 -1.225,0.9; 3 1.225,0.9 | smd 0.6 x 1.8: 2 0,0.9 | smd 1.3 x 0.9: S1 -1.85,-1.05; S2 1.85,-1.05 | hole 0.75: -2.125,0; 2.125,0
1,6/0,8 = drill 0.813 pad 1.6 octagon: 1 0,0
TP11R = smd 1.1 x 1.1: TP 0,0
HWQFN24_PCAL_NXP-L = smd 0.708 x 0.255: 1 -1.891,1.25; 2 -1.891,0.75; 3 -1.891,0.25; 4 -1.891,-0.25; 5 -1.891,-0.75; 6 -1.891,-1.25; 13 1.891,-1.25; 14 1.891,-0.75; 15 1.891,-0.25; 16 1.891,0.25; 17 1.891,0.75; 18 1.891,1.25 | smd 0.255 x 0.708: 7 -1.25,-1.891; 8 -0.75,-1.891; 9 -0.25,-1.891; 10 0.25,-1.891; 11 0.75,-1.891; 12 1.25,-1.891; 19 1.25,1.891; 20 0.75,1.891; 21 0.25,1.891; 22 -0.25,1.891; 23 -0.75,1.891; 24 -1.25,1.891 | smd 2.261 x 2.261: 25 0,0
TO-236AB_NEX-M = smd 0.584 x 1.473: 1 -0.953,-1.079; 2 0.953,-1.079; 3 0,1.079
BATT_CON_THT = drill 1 square: P$1 -7.498,0; P$2 -4.998,0; P$3 -2.498,0; P$4 0.002,0; P$5 2.502,0; P$6 5.002,0; P$7 7.502,0
SMT-PAD_R3MM = smd 3 x 3: P$1 0,0
FH12-30S-0.5SH = smd 0.3 x 1.3: 1 -7.25,3.25; 2 -6.75,3.25; 3 -6.25,3.25; 4 -5.75,3.25; 5 -5.25,3.25; 6 -4.75,3.25; 7 -4.25,3.25; 8 -3.75,3.25; 9 -3.25,3.25; 10 -2.75,3.25; 11 -2.25,3.25; 12 -1.75,3.25; 13 -1.25,3.25; 14 -0.75,3.25; 15 -0.25,3.25; 16 0.25,3.25; 17 0.75,3.25; 18 1.25,3.25; 19 1.75,3.25; 20 2.25,3.25; 21 2.75,3.25; 22 3.25,3.25; 23 3.75,3.25; 24 4.25,3.25; 25 4.75,3.25; 26 5.25,3.25; 27 5.75,3.25; 28 6.25,3.25; 29 6.75,3.25; 30 7.25,3.25

### Placement (x,y rotation side)
5V_RPI  41.37,34.46 90 top
+  28.67,45.89 0 top
-  24.86,45.89 0 top
C1  32.08,38.67 90 top
CHG+  14.95,19.9 0 bottom
CHG-  29.7,19.9 0 bottom
D  21.05,45.89 0 top
D1  8.89,40.78 180 top
ESC+  8.84,50.89 180 top
ESC-  35.76,50.84 0 top
FAN_+  43.1,45.97 0 top
FAN_-  43.1,40.91 0 top
LED1  9.32,11.2 90 top
LED2  14.32,11.2 90 top
LED3  19.32,11.2 90 top
LED4  24.32,11.2 90 top
Q1  4.09,41.55 0 top
Q2  5.05,31.03 180 top
Q3  39.52,31.16 0 top
R1  4.09,34.64 0 top
R2  150  [R0603']  8.89,44.67 270 top
R3  33.19,27.22 90 top
R4  1.86,34 270 top
R5  200  [R0603']  5.74,27.88 180 top
R6  34.9,41.7 0 top
R7  34.9,42.97 180 top
R8  33.58,37.84 270 top
R9  36.73,30.52 90 top
R10  12.16,14.14 0 top
R11  15.03,14.14 0 top
R12  18.61,14.14 180 top
R13  23.62,14.14 180 top
S1  31.98,3.09 0 top
SCL1  24.86,52.62 0 top
SCL2  26.51,52.62 0 top
SDA1  20.67,52.62 0 top
SDA2  22.32,52.62 0 top
TP1  30.53,37.1 0 bottom
U1  36.73,38.57 90 top
U3  38.12,42.59 270 top
U4  35.63,28.21 0 top
U$1  22.32,49.7 180 top
U$2  22.32,14.14 0 bottom
X1  22.32,33.93 0 top

### Tracks (layer width: path | path; a pad name or v marks a point on that pad's centre or on a via)
0V  (via drill 0.3)
  Top 0.254: X1.7 18.07,36.4 18.28,36.19 19.24,36.19 19.48,36.42 19.48,37.08 X1.10 19.57,37.84 19.33,38.08 18.7,38.08 18.51,38.27 18.32,38.08 18.07,37.84 X1.7
  Top 0.305: R3.1 33.19,26.13 v33.75,25.57 35.02,25.57 U4.2 | D1.C 9.08,39.54 v9.85,39.54 | Q2.3 4.16,32.3 v4.54,31.92 | v5.81,31.92 6.19,32.3 Q2.2 | U3.2 37.97,42.56 v38.11,42.56
  Top 0.508: R7.1 36,42.58 36.15,42.58 36.37,42.36 36.37,42.31 U3.2
  Bottom 0.305: v9.85,39.54 9.85,35.73 | v28.67,40.81 33.94,40.81 34.56,40.18 34.56,39.14 34.27,38.84 33.08,38.84 | v21.05,47.16 21.05,50.95 v21.46,51.35
  other vias: 7.08,10.33 7.08,9.06 7.08,7.79 10.89,7.79 10.89,9.06 12.16,9.06 12.16,7.79 15.97,9.06 15.97,7.79 17.24,7.79 17.24,9.06 21.05,9.06 21.05,7.79 21.05,10.33 21.05,11.6 17.24,11.6 17.24,10.33 12.16,10.33 12.16,11.6 7.08,11.6 7.72,9.06 7.72,9.7 7.08,9.7 7.72,10.33 7.72,10.97 7.08,10.97 7.08,8.43 7.72,8.43 7.72,7.79 10.89,8.43 11.53,8.43 11.53,9.06 11.53,9.7 11.53,10.33 11.53,10.97 11.53,11.6 12.16,10.97 12.16,9.7 12.8,9.7 12.8,10.33 12.8,10.97 12.8,9.06 12.8,8.43 12.16,8.43 11.53,7.79 12.8,7.79 8.35,8.43 10.26,8.43 13.43,8.43 15.34,8.43 15.97,8.43 16.61,8.43 16.61,9.06 16.61,7.79 16.61,10.33 16.61,9.7 16.61,10.97 17.24,9.7 17.24,10.97 16.61,11.6 17.88,8.43 17.88,9.06 17.88,7.79 17.24,8.43 20.42,8.43 21.05,8.43 21.05,9.7 21.05,10.97 21.69,11.6 21.69,10.97 21.69,10.33 21.69,9.7 21.69,9.06 21.69,8.43 21.69,7.79 22.32,7.79 22.32,8.43 22.32,9.06 22.32,9.7 22.32,10.33 22.32,10.97 22.32,11.6 22.96,8.43 25.5,8.43 26.13,8.43 26.13,9.06 26.13,9.7 26.13,10.33 26.77,9.7 26.77,9.06 26.77,8.43 26.77,7.79 26.13,7.79 24.33,38.91 24.84,38.91 25.35,38.91 39.6,38.27 39.6,37.76 21.05,35.73 21.05,34.46 21.05,33.19 22.32,33.19 22.32,34.46 22.32,35.73 23.59,35.73 23.59,34.46 23.59,33.19 24.86,33.19 24.86,34.46 24.86,35.73 26.13,35.73 26.13,34.46 26.13,33.19 19.78,33.19 18.51,35.73 19.78,31.92 21.05,31.92 22.32,31.92 23.59,31.92 24.86,31.92 26.13,31.92 26.13,30.65 27.4,30.65 24.86,30.65 23.59,30.65 22.32,30.65 21.05,30.65 19.78,30.65 18.51,30.65 18.51,31.92 4.54,30.65 5.81,30.65 31.21,47.16 31.21,45.89 32.48,45.89 33.75,45.89 35.02,45.89 36.29,45.89 37.56,45.89 37.56,47.16 36.29,47.16 35.02,47.16 33.75,47.16 32.48,47.16 31.21,48.43 31.21,49.7 31.21,50.97 31.21,52.24 31.21,53.51 29.94,53.51 29.94,52.24 29.94,50.97 28.67,50.97 28.67,52.24 28.67,53.51 28.67,48.43 28.67,47.16 27.4,47.16 26.13,47.16 26.13,45.89 26.13,44.62 26.13,43.35 24.86,43.35 24.86,42.08 26.13,42.08 26.13,40.81 24.86,40.81 27.4,40.81 27.4,42.08 27.4,43.35 27.4,44.62 27.4,45.89 28.67,44.62 28.67,43.35 28.67,42.08 21.05,39.54 22.32,39.54 21.05,40.81 21.05,42.08 22.32,42.08 22.32,43.35 21.05,43.35 21.05,44.62 22.32,44.62 22.32,47.16 26.13,26.84 27.4,26.84 28.67,26.84 28.67,25.57 27.4,25.57 26.13,25.57 26.13,24.3 27.4,24.3 28.67,24.3 18.51,26.84 19.78,26.84 19.78,25.57 18.51,25.57 18.51,24.3 19.78,24.3 19.78,23.03 19.78,21.76 19.78,20.49 19.78,19.22 21.05,19.22 21.05,20.49 22.32,20.49 21.05,25.57 21.05,26.84
  pour Top (rank 6, no thermals): 18.13,54.78 18.13,47.8 17.62,47.8 17.62,43.98 45.18,43.98 45.18,54.78
  pour Bottom (isolate 0.406, rank 6, no thermals): 12.29,56.05 12.29,39.92 10.64,38.27 -1.81,38.27 -1.81,-3.64 45.18,-3.64 45.18,56.05
  pour Bottom (rank 5, no thermals): 19.25,54.78 19.25,38.27 36.29,38.27 36.29,54.78
  pour Top: 5.81,11.6 6.45,12.23 25.5,12.23 27.4,10.33 27.4,8.5 28.14,7.76 43.38,7.76 43.38,-1.1 5.81,-1.1
  pour Top (rank 6, no thermals): 18.51,47.08 18.51,-4.1 33.52,-4.1 33.52,47.08
  pour Top (rank 6, no thermals): 35.02,40.81 38.83,40.81 40.1,40.81 40.1,35.73 33.75,35.73
+5V
  Top 0.127: X1.30 X1.29 | X1.28 X1.27
  Top 0.254: X1.26 X1.27 | X1.29 X1.28 28.67,37.08 28.67,36.58
  Top 0.762: FAN_+.1 41.53,45.97 40.33,44.77 | 40.33,44.77 29.79,44.77 +.P$2 | R9.2 39.27,33.77 39.27,35.48 40.81,37.03 40.81,44.29 40.33,44.77
  Top 2.032: 28.67,36.58 28.67,31.92 28.91,31.68 32.85,31.68 32.91,31.74 37.11,31.74
  pour Top (no thermals): 35.71,32.99 38.38,32.99 38.38,30.68 35.71,30.68
+5V_RPI
  pour Top (no thermals): 39.09,35.73 39.09,28.11 43.91,28.11 43.91,35.73
+12V  (via drill 0.3)
  Top 0.254: X1.6 X1.5
  Bottom 2.032: v16.43,35.32 14.95,33.84 CHG+.P$1
  other vias: 17.07,35.32 15.8,35.32 17.07,35.96 16.43,35.96 15.8,35.96 16.43,34.69 15.8,34.69 17.07,34.69
  pour Top (isolate 0.406, rank 4, no thermals): 13.43,52.24 17.5,52.24 17.5,44.62 14.96,44.62 14.83,44.75 14.83,47.54 13.43,48.94
  pour Top (isolate 0.406, no thermals): 11.15,55.29 11.15,38.27 5.81,38.27 4.54,37 4.54,34.46 5.81,33.19 17.88,33.19 17.88,55.29
  pour Bottom: 15.54,36.21 15.54,34.43 17.32,34.43 17.32,36.34 15.8,36.34 15.67,36.21
DOCK-COMM  (via drill 0.3)
  Top 0.305: X1.14 21.57,35.26 v21.74,35.09 | v21.76,27.4 24.86,24.3 24.86,21.07 v22.32,18.53
  Bottom 0.305: v21.74,35.09 21.74,27.4 v21.76,27.4 | v22.32,18.53 U$2.P$1
ESC_+  (via drill 0.3)
  Top 0.254: R2.1 6.72,45.62 v4.54,47.8
  other vias: 0.73,52.24 0.73,50.97 0.73,49.7 0.73,48.43 0.73,47.16 4.54,48.43 2,48.43 3.27,48.43 2,49.7 3.27,49.7 4.54,49.7 4.54,50.97 4.54,52.24 4.54,53.51 3.27,53.51 2,53.51 2,52.24 1.37,52.24 0.73,51.61 0.73,50.34 0.73,49.07 0.73,47.8 2,47.8 1.37,47.8 1.37,48.43 1.37,49.07 1.37,49.7 1.37,50.34 1.37,50.97 1.37,51.61 1.37,52.88 2,52.88 2.64,52.88 2.64,53.51 3.27,52.88 3.91,52.88 3.91,53.51 4.54,52.88 4.54,51.61 4.54,50.34 3.91,49.7 2.64,49.7 2,49.07 2.64,49.07 2.64,48.43 2.64,47.8 3.27,47.8 3.91,47.8 4.54,49.07 5.18,49.07 5.18,49.7 5.18,50.34 5.18,50.97 5.18,51.61 5.18,52.24 5.18,52.88 5.18,53.51 3.91,50.34 2,50.34 3.91,48.43 3.91,49.07 3.27,49.07
  pour Top (no thermals): -1.81,54.78 10.39,54.78 10.39,40.81 -1.81,40.81
  pour Bottom (no thermals): -3.08,56.05 10.39,56.05 10.39,40.81 -0.54,40.81 -0.54,42.08 -3.08,42.08
IO_P0_0  (via drill 0.3)
  Top 0.254: U1.1 35.47,36.54 v34.67,35.73
  Bottom 0.254: v34.67,35.73 34.67,35.76 35.38,36.47 35.38,37.69 34.92,38.14 20.98,38.14 19.82,39.3 U$1.P$5
IO_P0_1  (via drill 0.3)
  Top 0.254: U1.2 35.98,36.05 v35.66,35.73 | v30.53,29.99 28.42,27.88 R5.1
  Bottom 0.254: v35.66,35.73 33.6,33.67 32.67,33.67 32.38,33.39 32.38,32.17 30.53,30.31 v30.53,29.99
IO_P0_2  (via drill 0.3)
  Top 0.254: v36.47,35.93 U1.3
  Top 0.305: R6.2 v34.9,40.99 v34.89,40.99
  Bottom 0.254: v34.89,40.99 35.4,40.48 35.4,38.55 36.47,37.48 v36.47,35.93
IO_P0_3  (via drill 0.3)
  Top 0.254: U1.4 36.98,35.7 36.19,34.92 34.59,34.92 v32.86,33.19
  Top 0.381: v31.21,29.99 31.21,29.81 29.94,28.54 29.94,19.22 27.4,16.68 14.7,16.68 12.87,14.85 R10.2
  Bottom 0.254: v32.86,33.19 32.86,32.11 31.21,30.46 v31.21,29.99
IO_P0_4  (via drill 0.3)
  Top 0.254: U1.5 37.48,35.66 36.35,34.54 35.1,34.54 v33.75,33.19
  Top 0.381: R11.2 15.74,15.49 16.43,16.17 27.61,16.17 30.45,19.01 30.45,28.31 31.76,29.61 31.76,29.9 v31.85,29.99
  Bottom 0.254: v33.75,33.19 33.75,32.46 31.85,30.55 v31.85,29.99
IO_P0_5  (via drill 0.3)
  Top 0.254: U1.6 37.86,36.57 37.86,35.51 36.51,34.16 35.26,34.16 35.02,33.92 v35.02,33.19
  Top 0.381: v32.48,29.99 32.39,29.9 32.39,29.53 30.96,28.1 30.96,18.8 27.82,15.66 18.64,15.66 17.9,14.93 R12.2
  Bottom 0.254: v35.02,33.19 32.48,30.65 v32.48,29.99
IO_P0_6  (via drill 0.3)
  Top 0.254: v36.29,33.68 36.39,33.77 36.67,33.77 38.62,35.73 U1.7
  Top 0.381: R13.2 22.91,14.62 23.44,15.16 28.03,15.16 31.47,18.59 31.47,27.89 33.03,29.45 33.03,29.95 v33.09,30.02
  Bottom 0.254: v36.29,33.68 33.09,30.48 v33.09,30.02
IO_P1_2  (via drill 0.3)
  Top 0.254: v41.87,39.25 41.86,39.26 | U1.12 39.25,39.83 v40.08,40.66
  Top 0.305: U4.1 33.88,27.93 R3.2 33.49,28.22 43.44,28.22 44.17,28.95 44.17,38.7 43.62,39.25 v41.87,39.25
  Bottom 0.254: v40.08,40.66 41.09,40.66 41.87,39.88 v41.87,39.25
N$1
  Top 0.305: 1.86,36.69 R4.1 3.31,34.71 R1.1
  Top 0.381: Q1.1 1.86,36.69
N$2
  Top 0.305: R2.2 D1.A
N$3
  Top 0.305: Q2.4 0.73,30.93 0.73,32.58 1.44,33.29 R4.2
N$4
  Top 0.305: Q2.1 5.66,29.76 4.75,28.85 4.75,27.92 R5.2
N$5
  Top 0.305: U3.1 36.6,43.98 35.18,43.98 34.19,42.99 R7.2 R6.1
N$6  (via drill 0.3)
  Top 0.508: U3.3 39.2,41.43 | 39.2,41.43 v39.21,41.42 | v39.21,41.9 39.21,41.45 39.2,41.43
  Bottom 0.508: FAN_-.1 42.59,41.42 v39.21,41.42 v39.21,41.9
N$7
  Top 0.254: U1.24 33.77,37.32 R8.2
N$8
  Top 0.305: Q3.4 37.55,29.81 R9.1 36.2,29.29 U4.3
N$9
  Top 0.508: LED1.2 10.94,14.14 R10.1
N$10
  Top 0.508: LED2.2 R11.1
N$11
  Top 0.508: LED3.2 R12.1
N$12
  Top 0.508: LED4.2 R13.1
N$13
  Top 0.254: X1.13 21.07,38.88 21.53,39.34 21.53,45.41 D.P$2
SCL  (via drill 0.3)
  Top 0.254: X1.18 v23.57,41.32 23.57,48.45 U$1.P$3 | U1.19 34.2,39.83 v34.06,39.97
  Top 0.305: U$1.P$3 24.86,49.74 SCL1.1 SCL2.1
  Bottom 0.254: v34.06,39.97 24,39.97 23.44,40.53 23.44,41.19 v23.57,41.32
SDA  (via drill 0.3)
  Top 0.254: X1.17 v23.07,41.78 23.07,48.95 | 23.07,48.95 | U1.20 34.08,39.33 v34.06,39.34 | SDA2.1 U$1.P$4 23.07,48.95
  Top 0.305: SDA2.1 SDA1.1
  Bottom 0.254: v34.06,39.34 33.83,39.34 33.6,39.57 23.84,39.57 23.1,40.32 | 23.06,40.35 23.1,40.32 | 23.1,40.32 23.1,40.34 23.06,40.37 23.06,41.34 23.07,41.36 v23.07,41.78
SW  (via drill 0.3)
  Top 0.254: X1.11 20.07,35.49 v20.11,35.45 | v17.24,32.05 v17.24,28.44 | v17.24,27.37 17.24,19.22 18.51,17.95 v24.86,17.95 | v26.13,14.14 29.94,10.33 29.94,7.79 31.98,5.76 S1.2
  Bottom 0.254: v20.11,35.45 17.24,32.58 v17.24,32.05 | v17.24,28.44 v17.24,27.37 | v24.86,17.95 25.5,17.32 25.5,14.78 v26.13,14.14
VDD  (via drill 0.3)
  Top 0.127: U1.18 35.47,39.85 35.4,39.78 35.4,38.85 35.38,38.83 U1.21
  Top 0.254: X1.21 X1.22 X1.23 | U1.21 34.24,38.83 34.21,38.8 | v30.53,36.19 30.53,37.83 C1.2
  Top 0.381: X1.22 25.57,38.09 26.01,38.52 26.01,38.55 31.24,38.55 C1.2 32.74,39.38 R8.1 | R8.1 33.83,38.8 34.21,38.8 | U1.23 34.3,37.83 R8.1
  Bottom 0.152: TP1.TP v30.53,36.19

### Text on the board
tNames: + | FAN | _ | SPSU